# Altium schematic sheet Bank225.SchDoc: Bank225
size A3; Organization: Altium Limited; Address1: L3, 12a Rodborough Rd; Address2: Frenchs Forest; Address3: NSW; Address4: Australia 2086
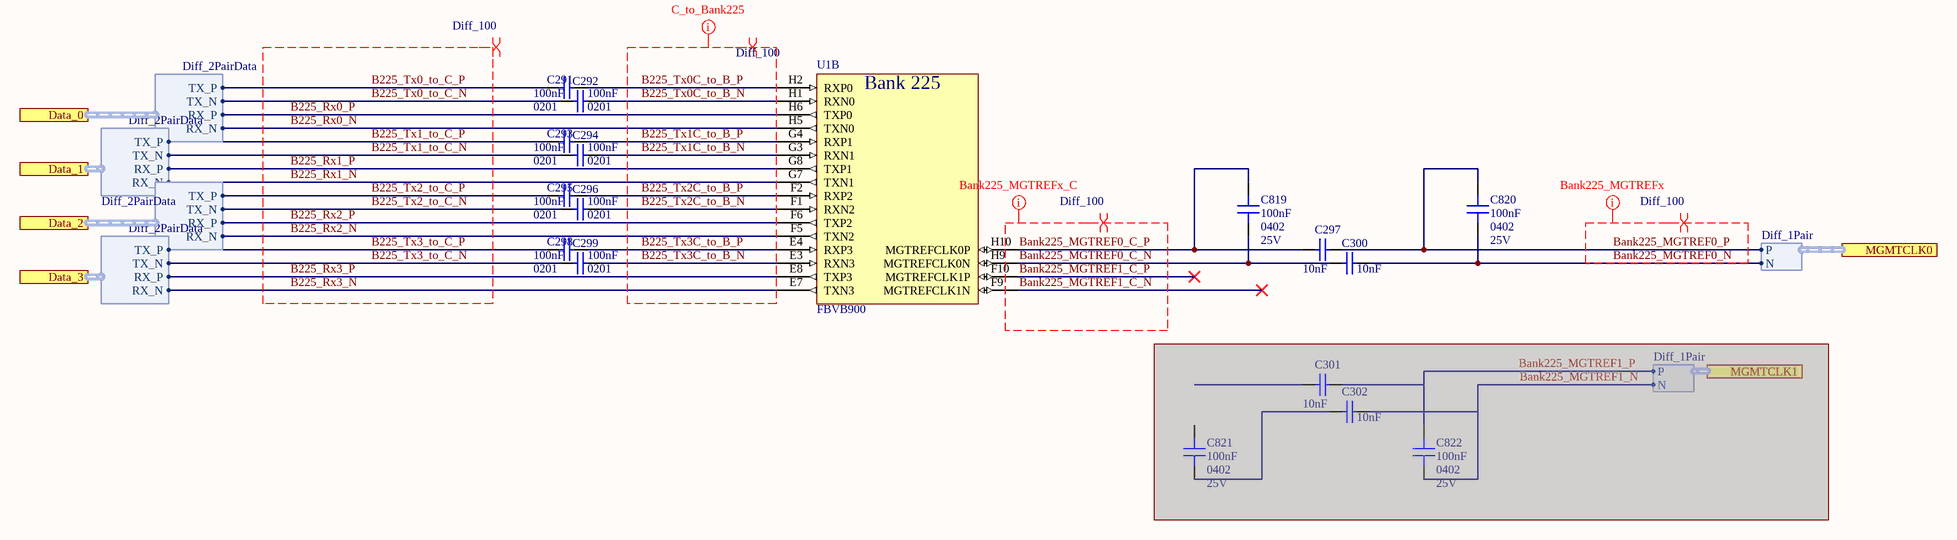
[diagram p0: Bank225.SchDoc]

## Parts
C291  100nF  Case/Package: 0201  [CAP 0201/0603 KK]
C292  100nF  Case/Package: 0201  [CAP 0201/0603 KK]
C293  100nF  Case/Package: 0201  [CAP 0201/0603 KK]
C294  100nF  Case/Package: 0201  [CAP 0201/0603 KK]
C295  100nF  Case/Package: 0201  [CAP 0201/0603 KK]
C296  100nF  Case/Package: 0201  [CAP 0201/0603 KK]
C297  10nF  [CAP 0201/0603 KK]
C298  100nF  Case/Package: 0201  [CAP 0201/0603 KK]
C299  100nF  Case/Package: 0201  [CAP 0201/0603 KK]
C300  10nF  [CAP 0201/0603 KK]
C301  10nF  [CAP 0201/0603 KK]  (masked out: inside a compile mask, not in the netlist)
C302  10nF  [CAP 0201/0603 KK]  (masked out: inside a compile mask, not in the netlist)
C819  100nF  Case/Package: 0402  Voltage Rating: 25V  [CAP 0402/1005 KK]
C820  100nF  Case/Package: 0402  Voltage Rating: 25V  [CAP 0402/1005 KK]
C821  100nF  Case/Package: 0402  Voltage Rating: 25V  [CAP 0402/1005 KK]  (masked out: inside a compile mask, not in the netlist)
C822  100nF  Case/Package: 0402  Voltage Rating: 25V  [CAP 0402/1005 KK]  (masked out: inside a compile mask, not in the netlist)
U1  FBVB900  [FBVB900 XX]  (part B of 23)

## Ports
Data_0 (harness Diff_2PairData), Data_1 (harness Diff_2PairData), Data_2 (harness Diff_2PairData), Data_3 (harness Diff_2PairData), MGMTCLK0 (harness Diff_1Pair), MGMTCLK1 (harness Diff_1Pair)

## Harnesses
Diff_1Pair: P, N
Diff_2PairData: RX_P, RX_N, TX_P, TX_N

## Nets
B225_Rx0_N: U1.H5(TXN0) ; port Data_0.RX_N
B225_Rx0_P: U1.H6(TXP0) ; port Data_0.RX_P
B225_Rx1_N: U1.G7(TXN1) ; port Data_1.RX_N
B225_Rx1_P: U1.G8(TXP1) ; port Data_1.RX_P
B225_Rx2_N: U1.F5(TXN2) ; port Data_2.RX_N
B225_Rx2_P: U1.F6(TXP2) ; port Data_2.RX_P
B225_Rx3_N: U1.E7(TXN3) ; port Data_3.RX_N
B225_Rx3_P: U1.E8(TXP3) ; port Data_3.RX_P
B225_Tx0_to_C_N: C292.1 ; port Data_0.TX_N
B225_Tx0_to_C_P: C291.1 ; port Data_0.TX_P
B225_Tx0C_to_B_N: C292.2 U1.H1(RXN0)
B225_Tx0C_to_B_P: C291.2 U1.H2(RXP0)
B225_Tx1_to_C_N: C294.1 ; port Data_1.TX_N
B225_Tx1_to_C_P: C293.1 ; port Data_1.TX_P
B225_Tx1C_to_B_N: C294.2 U1.G3(RXN1)
B225_Tx1C_to_B_P: C293.2 U1.G4(RXP1)
B225_Tx2_to_C_N: C296.1 ; port Data_2.TX_N
B225_Tx2_to_C_P: C295.1 ; port Data_2.TX_P
B225_Tx2C_to_B_N: C296.2 U1.F1(RXN2)
B225_Tx2C_to_B_P: C295.2 U1.F2(RXP2)
B225_Tx3_to_C_N: C299.1 ; port Data_3.TX_N
B225_Tx3_to_C_P: C298.1 ; port Data_3.TX_P
B225_Tx3C_to_B_N: C299.2 U1.E3(RXN3)
B225_Tx3C_to_B_P: C298.2 U1.E4(RXP3)
Bank225_MGTREF0_C_N: C300.1 C819.2 U1.H9(MGTREFCLK0N)
Bank225_MGTREF0_C_P: C297.1 C819.1 U1.H10(MGTREFCLK0P)
Bank225_MGTREF0_N: C300.2 C820.2 ; port MGMTCLK0.N
Bank225_MGTREF0_P: C297.2 C820.1 ; port MGMTCLK0.P
Bank225_MGTREF1_C_N: U1.F9(MGTREFCLK1N)
Bank225_MGTREF1_C_P: U1.F10(MGTREFCLK1P)

## Layout directives
net class C_to_Bank225: B225_Tx0C_to_B_N, B225_Tx0C_to_B_P, B225_Tx1C_to_B_N, B225_Tx1C_to_B_P, B225_Tx2C_to_B_N, B225_Tx2C_to_B_P, B225_Tx3C_to_B_N, B225_Tx3C_to_B_P
net class Bank225_MGTREFx_C: Bank225_MGTREF0_C_N, Bank225_MGTREF0_C_P, Bank225_MGTREF1_C_N, Bank225_MGTREF1_C_P
differential pair; differential pair class Diff_100: B225_Rx0_N, B225_Rx0_P, B225_Rx1_N, B225_Rx1_P, B225_Rx2_N, B225_Rx2_P, B225_Rx3_N, B225_Rx3_P, B225_Tx0_to_C_N, B225_Tx0_to_C_P, B225_Tx0C_to_B_N, B225_Tx0C_to_B_P, B225_Tx1_to_C_N, B225_Tx1_to_C_P, B225_Tx1C_to_B_N, B225_Tx1C_to_B_P, B225_Tx2_to_C_N, B225_Tx2_to_C_P, B225_Tx2C_to_B_N, B225_Tx2C_to_B_P, B225_Tx3_to_C_N, B225_Tx3_to_C_P, B225_Tx3C_to_B_N, B225_Tx3C_to_B_P, Bank225_MGTREF0_C_N, Bank225_MGTREF0_C_P, Bank225_MGTREF0_N, Bank225_MGTREF0_P, Bank225_MGTREF1_C_N, Bank225_MGTREF1_C_P
net class Bank225_MGTREFx: Bank225_MGTREF0_N, Bank225_MGTREF0_P

## Notes on the sheet
- Title
- Size:
- Date:
- A3
- Number:
- Time:
- Revision:
- Sheet
- of
- File:
- (in symbol FBVB900, part B) Bank 225

## Library data of the parts
C291-C296 C298 C299 = Capacitor: CAP CER 0.1UF 16V X5R 0201; Manufacturer: Murata; Manufacturer Part Number: GRM033R61C104ME84D; Tolerance: 20%; Supplier 1: Digi-Key; Supplier Part Number 1: 490-9986-1-ND; RoHS: Yes; Category: Ceramic Capacitors; Stock 1: 519119; Pricing 1: 1=0,10000, 10=0,06000, 100=0,02670, 500=0,01906, 1000=0,01497, 2500=0,01361, 5000=0,01252 (USD); Mount: Surface Mount; Weight: 1.2E-05oz; Case Code (Metric): 0603; Min Operating Temperature: -55°C; Max Operating Temperature: 85°C; Capacitance: 100nF; Packaging: Tape and Reel; Voltage Rating: 16V; Dielectric: X5R; Termination: SMD/SMT; Voltage Rating (DC): 16V; Package Quantity: 15000; Length: 0.024inch; Height: 0.3mm; Width: 0.3mm; Thickness: 0.013inch; ComponentLink1URL: http://www.mouser.com/ds/2/281/c02e-2905.pdf?src-supplier=Mouser; ComponentLink1Description: http://www.mouser.com/ds/2/281/c02e-2905.pdf?src-supplier=Mouser; ComponentLink2URL: http://search.murata.co.jp/Ceramy/image/img/A01X/G101/ENG/GRM033R61C104ME84-01.pdf?src-supplier=Digi-Key; ComponentLink2Description: http://search.murata.co.jp/Ceramy/image/img/A01X/G101/ENG/GRM033R61C104ME84-01.pdf?src-supplier=Digi-Key
  C292 C294 C296 C299: Case Code (Imperial): 0201
C297 C300-C302 = Capacitor: CAP CER 10000PF 16V X7R 0201; Manufacturer: Murata; Manufacturer Part Number: GRM033R71C103KE14D; Tolerance: 10%; Supplier 1: Digi-Key; Supplier Part Number 1: 490-14453-1-ND; RoHS: No; Category: Ceramic Capacitors; Stock 1: 188777; Pricing 1: 1=0,10000, 10=0,01900, 100=0,00870, 500=0,00620, 1000=0,00487, 2500=0,00443, 5000=0,00407 (USD); Voltage Rating (DC): 16V; Dielectric: X7R; Capacitance: 10nF; Length: 600um; Width: 300um; Thickness: 300um; ComponentLink1URL: http://www.farnell.com/datasheets/2722745.pdf?src-supplier=Farnell; ComponentLink1Description: http://www.farnell.com/datasheets/2722745.pdf?src-supplier=Farnell; ComponentLink2URL: http://www.farnell.com/datasheets/2722745.pdf?src-supplier=Newark; ComponentLink2Description: http://www.farnell.com/datasheets/2722745.pdf?src-supplier=Newark; ComponentLink3URL: http://www.farnell.com/datasheets/2722745.pdf?src-supplier=Element14; ComponentLink3Description: http://www.farnell.com/datasheets/2722745.pdf?src-supplier=Element14; ComponentLink4URL: http://search.murata.co.jp/Ceramy/image/img/A01X/G101/ENG/GRM033R71C103KE14-01.pdf?src-supplier=Digi-Key; ComponentLink4Description: http://search.murata.co.jp/Ceramy/image/img/A01X/G101/ENG/GRM033R71C103KE14-01.pdf?src-supplier=Digi-Key
C819-C822 = Capacitor: Manufacturer: Murata; Manufacturer Part Number: GRM155R71E104KE14J; Tolerance: 10%; Dielectric: X7R; Supplier 1: Digi-Key; Supplier Part Number 1: 490-14603-1-ND; Stock 1: 89275; Pricing 1: 1 = 0,10000, 10 = 0,03400, 100 = 0,01520, 500 = 0,01088, 1000 = 0,00855, 2500 = 0,00778, 5000 = 0,00715 (USD); RoHS: Yes; Mount: Surface Mount; Weight: 0.000212oz; Case Code (Imperial): 0402; Case Code (Metric): 1005; Min Operating Temperature: -55°C; Max Operating Temperature: 125°C; Packaging: Tape and Reel; Capacitance: 100nF; Termination: SMD/SMT; Composition: Ceramic; Voltage Rating (DC): 25V; Package Quantity: 50000; Length: 0.039inch; Height: 0.5mm; Width: 0.5mm; Thickness: 0.022inch; ComponentLink1URL: http://www.mouser.com/ds/2/281/c02e-2905.pdf?src-supplier=Mouser; ComponentLink1Description: http://www.mouser.com/ds/2/281/c02e-2905.pdf?src-supplier=Mouser; ComponentLink2URL: http://search.murata.co.jp/Ceramy/image/img/A01X/G101/ENG/GRM155R71E104KE14-01.pdf?src-supplier=Digi-Key; ComponentLink2Description: http://search.murata.co.jp/Ceramy/image/img/A01X/G101/ENG/GRM155R71E104KE14-01.pdf?src-supplier=Digi-Key
U1 = FBVB900: FPGA Zynq UltraScale+ Family 192150 Cells 20nm Technology 0.85V 900-Pin FCBGA Tray; Manufacturer Part Number: XCZU4CG-1FBVB900E; Manufacturer: Xilinx; Peripherals: WDT,DMA; Interface: I2C,SPI,USB,Ethernet,MMC,SDIO,SD,UART,USART,EBI/EMI; Core Architecture: ARM; RAM Size: 256KB; Frequency: 500MHz; Number of I/Os: 204; Supplier 1: Mouser; Supplier Part Number 1: 217-CZU4CG-1FBVB900E; Stock 1: 3; Pricing 1: 1=0,00000, 5=1060,70000 (USD); RoHS: No; Case/Package: FCBGA; Min Operating Temperature: 0°C; Max Operating Temperature: 100°C; Packaging: Tray; ComponentLink1URL: https://www.xilinx.com/support/documentation/data_sheets/ds891-zynq-ultrascale-plus-overview.pdf?src-supplier=Digi-Key; ComponentLink1Description: https://www.xilinx.com/support/documentation/data_sheets/ds891-zynq-ultrascale-plus-overview.pdf?src-supplier=Digi-Key; ComponentLink2URL: https://www.xilinx.com/support/documentation/data_sheets/ds925-zynq-ultrascale-plus.pdf?src-supplier=Digi-Key; ComponentLink2Description: https://www.xilinx.com/support/documentation/data_sheets/ds925-zynq-ultrascale-plus.pdf?src-supplier=Digi-Key; Supplier 2: Avnet; Supplier 3: Digi-Key; Supplier Part Number 2: XCZU4CG-1FBVB900E; Supplier Part Number 3: XCZU4CG-1FBVB900E-ND